# EAGLE schematic weather_station (EAGLE 9.6.2)
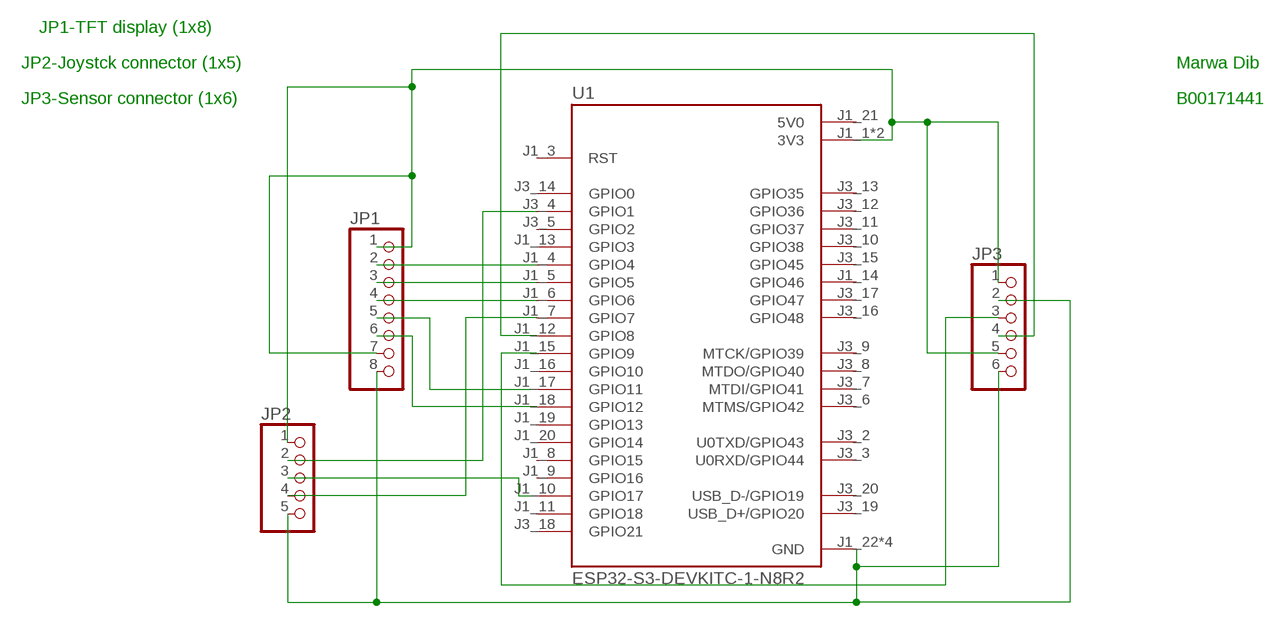
[diagram p0: schematic, sheet 1]

## Parts
JP1  PINHD-1X8  [1X08]
JP2  PINHD-1X5  [1X05]
JP3  PINHD-1X6  [1X06]
U1  ESP32-S3-DEVKITC-1-N8R2  [XCVR_ESP32-S3-DEVKITC-1-N8R2]

## Nets
J_TFT: JP1.3 U1.J1_5(GPIO5)
N$1: JP1.2 U1.J1_4(GPIO4)
N$2: JP2.2 U1.J3_4(GPIO1)
N$3: JP1.4 U1.J1_6(GPIO6)
N$4: JP1.5 U1.J1_17(GPIO11)
N$5: JP1.6 U1.J1_18(GPIO12)
N$6: JP1.8 JP2.5 JP3.2 JP3.6 U1.J1_22(GND) U1.J3_1(GND) U1.J3_21(GND) U1.J3_22(GND)
N$7: JP1.1 JP1.7 JP2.1 JP3.1 JP3.5 U1.J1_1(3V3) U1.J1_2(3V3)
N$8: JP2.3 U1.J1_10(GPIO17)
N$9: JP2.4 U1.J1_7(GPIO7)
N$11: JP3.3 U1.J1_15(GPIO9)
N$13: JP3.4 U1.J1_12(GPIO8)
Unconnected: U1.J1_3(RST) U1.J1_8(GPIO15) U1.J1_9(GPIO16) U1.J1_11(GPIO18) U1.J1_13(GPIO3) U1.J1_14(GPIO46) U1.J1_16(GPIO10) U1.J1_19(GPIO13) U1.J1_20(GPIO14) U1.J3_2(U0TXD/GPIO43) U1.J3_3(U0RXD/GPIO44) U1.J3_5(GPIO2) U1.J3_6(MTMS/GPIO42) U1.J3_7(MTDI/GPIO41) U1.J3_8(MTDO/GPIO40) U1.J3_9(MTCK/GPIO39) U1.J3_10(GPIO38) U1.J3_11(GPIO37) U1.J3_12(GPIO36) U1.J3_13(GPIO35) U1.J3_14(GPIO0) U1.J3_15(GPIO45) U1.J3_16(GPIO48) U1.J3_17(GPIO47) U1.J3_18(GPIO21) U1.J3_19(USB_D+/GPIO20) U1.J3_20(USB_D-/GPIO19)

## Notes on the sheet
- JP1-TFT display (1x8)
- JP2-Joystck connector (1x5) | Marwa Dib
- JP3-Sensor connector (1x6) | B00171441

## Power pins joined to a net without a drawn wire
5V0: U1.J1_21(5V0)

## Library data of the parts
JP1 = pinhead:PINHD-1X8: PIN HEADER
JP2 = pinhead:PINHD-1X5: PIN HEADER
JP3 = pinhead:PINHD-1X6: PIN HEADER
U1 = ESP32-S3-DEVKITC-1-N8R2:ESP32-S3-DEVKITC-1-N8R2; DATASHEET_URL: https://s3.amazonaws.com/snapeda/datasheet/ESP32-S3-DEVKITC-1-N8R2_Espressif_Systems.pdf; DESCRIPTION: WiFi Development Tools - 802.11 ESP32-S3 general-purpose development board, embeds ESP32-S3-WROOM-1-N8R2, with pin header; MANUFACTURER: Espressif Systems; MPN: ESP32-S3-DEVKITC-1-N8R2; PARTREV: V1; SOURCE_URL: https://www.snapeda.com/parts/ESP32-S3-DEVKITC-1-N8R2/Espressif+Systems/view-part/; STANDARD: Manufacturer Recommendations